# EasyEDA Pro project ProPrj_game_2026-11-26.epro

# Schematic Schematic1
Board Name: Board1; Create Date: 2026-11-06; Page Name: P1; Project Name: game; Schematic Name: Schematic1; Update Date: 2026-11-06; Company: EasyEDA.com; Page Size: A4; Version: V1.0
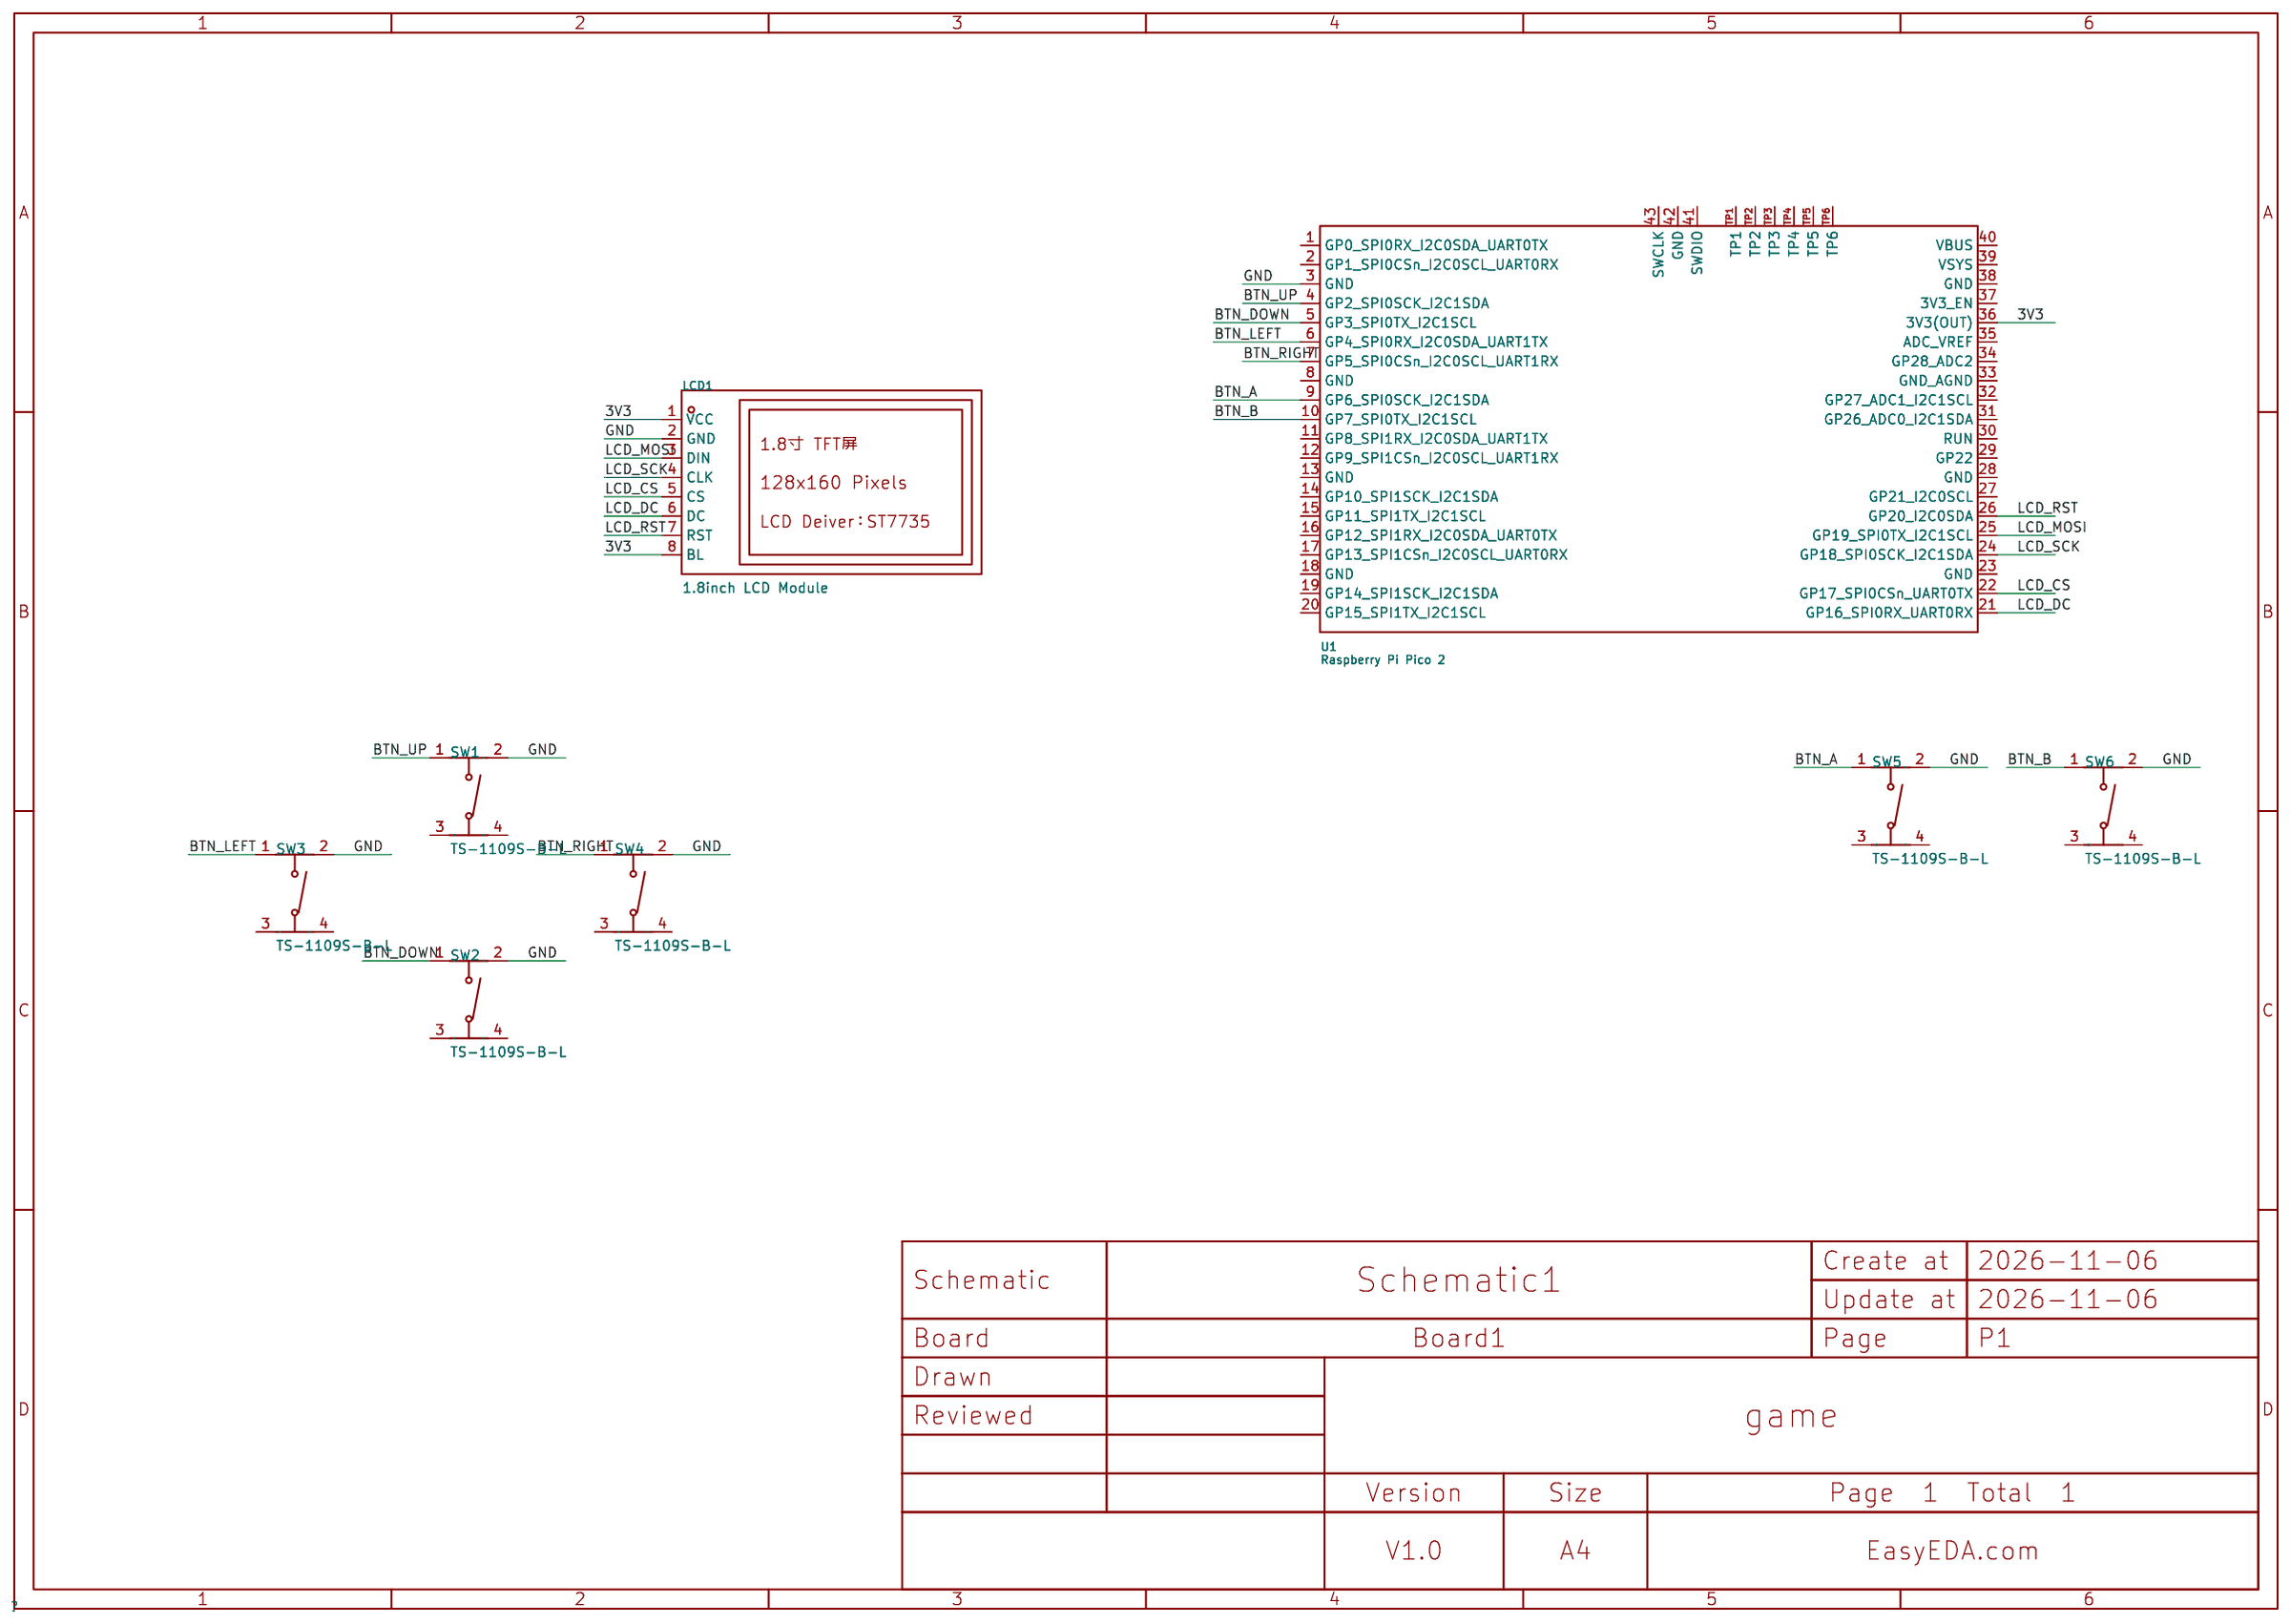
[diagram p0: schematic sheet]

## Parts
LCD1  1.8inch LCD Module  [LCD-TH_L56.5-W34.0_1-8INCH-LCD-MODULE]
SW1  TS-1109S-B-L  [SW-SMD_4P-L4.5-W4.5-P3.00-LS6.8]
SW2  TS-1109S-B-L  [SW-SMD_4P-L4.5-W4.5-P3.00-LS6.8]
SW3  TS-1109S-B-L  [SW-SMD_4P-L4.5-W4.5-P3.00-LS6.8]
SW4  TS-1109S-B-L  [SW-SMD_4P-L4.5-W4.5-P3.00-LS6.8]
SW5  TS-1109S-B-L  [SW-SMD_4P-L4.5-W4.5-P3.00-LS6.8]
SW6  TS-1109S-B-L  [SW-SMD_4P-L4.5-W4.5-P3.00-LS6.8]
U1  Raspberry Pi Pico 2  [COMM-SMD_L51.0-W21.0-P2.54_SC0916]

## Library data of the parts
LCD1 = 1.8inch LCD Module: Controller Type:ST7735S chip Interface:SPI Size:1.8 Dot Pixels:160x128 Operating Temperature:-30℃~+85℃ Operating Temperature:-30℃~+85℃ Display Range:35.4x28.03mm Voltage - Supply:3.3V Voltage - Supply:3.3V Function:Touch; LCSC Part Name: 树莓派 1.8寸LCD 迷你显示屏 扩展板 SPI接口 支持Arduino; Supplier Part: C359940; Manufacturer: Waveshare(微雪电子); JLCPCB Part Class: Extended Part; Datasheet: https://item.szlcsc.com/datasheet/1.8inch%2520LCD%2520Module/334757.html; Supplier: LCSC; Controller Type: ST7735S chip; Interface: SPI; Size: 1.8; Dot Pixels: 160x128; Operating Temperature: -30℃~+85℃; Display Range: 35.4x28.03mm; Voltage - Supply: 3.3V; Function: Touch
SW1-SW6 = TS-1109S-B-L: Circuit:SPST Actuator Style:Round Button Operating Force:160gf Mounting Style:Brick nogging Switch Length:4.5mm Switch Width:4.5mm Switch Height:9mm Strike Gundam:不带 Contact Current:50mA Voltage Rating (DC):12V Insulation Resistance:- Actuator/Cap Color:B; LCSC Part Name: 4.5*4.5*9mm 立贴 轻触开关; Supplier Part: C480325; Manufacturer: XKB Connection(中国星坤); Supplier Footprint: SMD; JLCPCB Part Class: Extended Part; Datasheet: https://atta.szlcsc.com/upload/public/pdf/source/20211011/CFAE96021CF3492A687EDA5E1FB4F9CF.pdf; Supplier: LCSC; Circuit: SPST; Actuator Style: Round Button; Operating Force: 160gf; Mounting Style: Brick nogging; Switch Length: 4.5mm; Switch Width: 4.5mm; Switch Height: 9mm; Strike Gundam: 不带; Contact Current: 50mA; Voltage Rating (DC): 12V; Actuator/Cap Color: Black; With Lamp: No; Mechanical Life: 10万次; Operating Temperature: -30℃~+85℃
U1 = Raspberry Pi Pico 2: LCSC Part Name: SC1631; Supplier Part: C41407547; Manufacturer: Raspberry Pi(树莓派); JLCPCB Part Class: Extended Part; Datasheet: https://item.szlcsc.com/datasheet/Raspberry%2520Pi%2520Pico%25202/43207606.html; Supplier: LCSC

## Nets
3V3: LCD1.1(VCC) LCD1.8(BL) U1.36(3V3(OUT))
GND: LCD1.2(GND) SW1.2 SW2.2 SW3.2 SW4.2 SW5.2 SW6.2 U1.3(GND)
BTN_A: SW5.1 U1.9(GP6_SPI0SCK_I2C1SDA)
BTN_B: SW6.1 U1.10(GP7_SPI0TX_I2C1SCL)
BTN_DOWN: SW2.1 U1.5(GP3_SPI0TX_I2C1SCL)
BTN_LEFT: SW3.1 U1.6(GP4_SPI0RX_I2C0SDA_UART1TX)
BTN_RIGHT: SW4.1 U1.7(GP5_SPI0CSn_I2C0SCL_UART1RX)
BTN_UP: SW1.1 U1.4(GP2_SPI0SCK_I2C1SDA)
LCD_CS: LCD1.5(CS) U1.22(GP17_SPI0CSn_UART0TX)
LCD_DC: LCD1.6(DC) U1.21(GP16_SPI0RX_UART0RX)
LCD_MOSI: LCD1.3(DIN) U1.25(GP19_SPI0TX_I2C1SCL)
LCD_RST: LCD1.7(RST) U1.26(GP20_I2C0SDA)
LCD_SCK: LCD1.4(CLK) U1.24(GP18_SPI0SCK_I2C1SDA)

Not connected (* = marked no-connect by the designer): SW1 3 4; SW2 3 4; SW3 3 4; SW4 3 4; SW5 3 4; SW6 3 4; U1 1(GP0_SPI0RX_I2C0SDA_UART0TX) 2(GP1_SPI0CSn_I2C0SCL_UART0RX) 8(GND) 11(GP8_SPI1RX_I2C0SDA_UART1TX) 12(GP9_SPI1CSn_I2C0SCL_UART1RX) 13(GND) 14(GP10_SPI1SCK_I2C1SDA) 15(GP11_SPI1TX_I2C1SCL) 16(GP12_SPI1RX_I2C0SDA_UART0TX) 17(GP13_SPI1CSn_I2C0SCL_UART0RX) 18(GND) 19(GP14_SPI1SCK_I2C1SDA) 20(GP15_SPI1TX_I2C1SCL) 23(GND) 27(GP21_I2C0SCL) 28(GND) 29(GP22) 30(RUN) 31(GP26_ADC0_I2C1SDA) 32(GP27_ADC1_I2C1SCL) 33(GND_AGND) 34(GP28_ADC2) 35(ADC_VREF) 37(3V3_EN) 38(GND) 39(VSYS) 40(VBUS) 41(SWDIO) 42(GND) 43(SWCLK) TP1 TP2 TP3 TP4 TP5 TP6

# Board PCB1
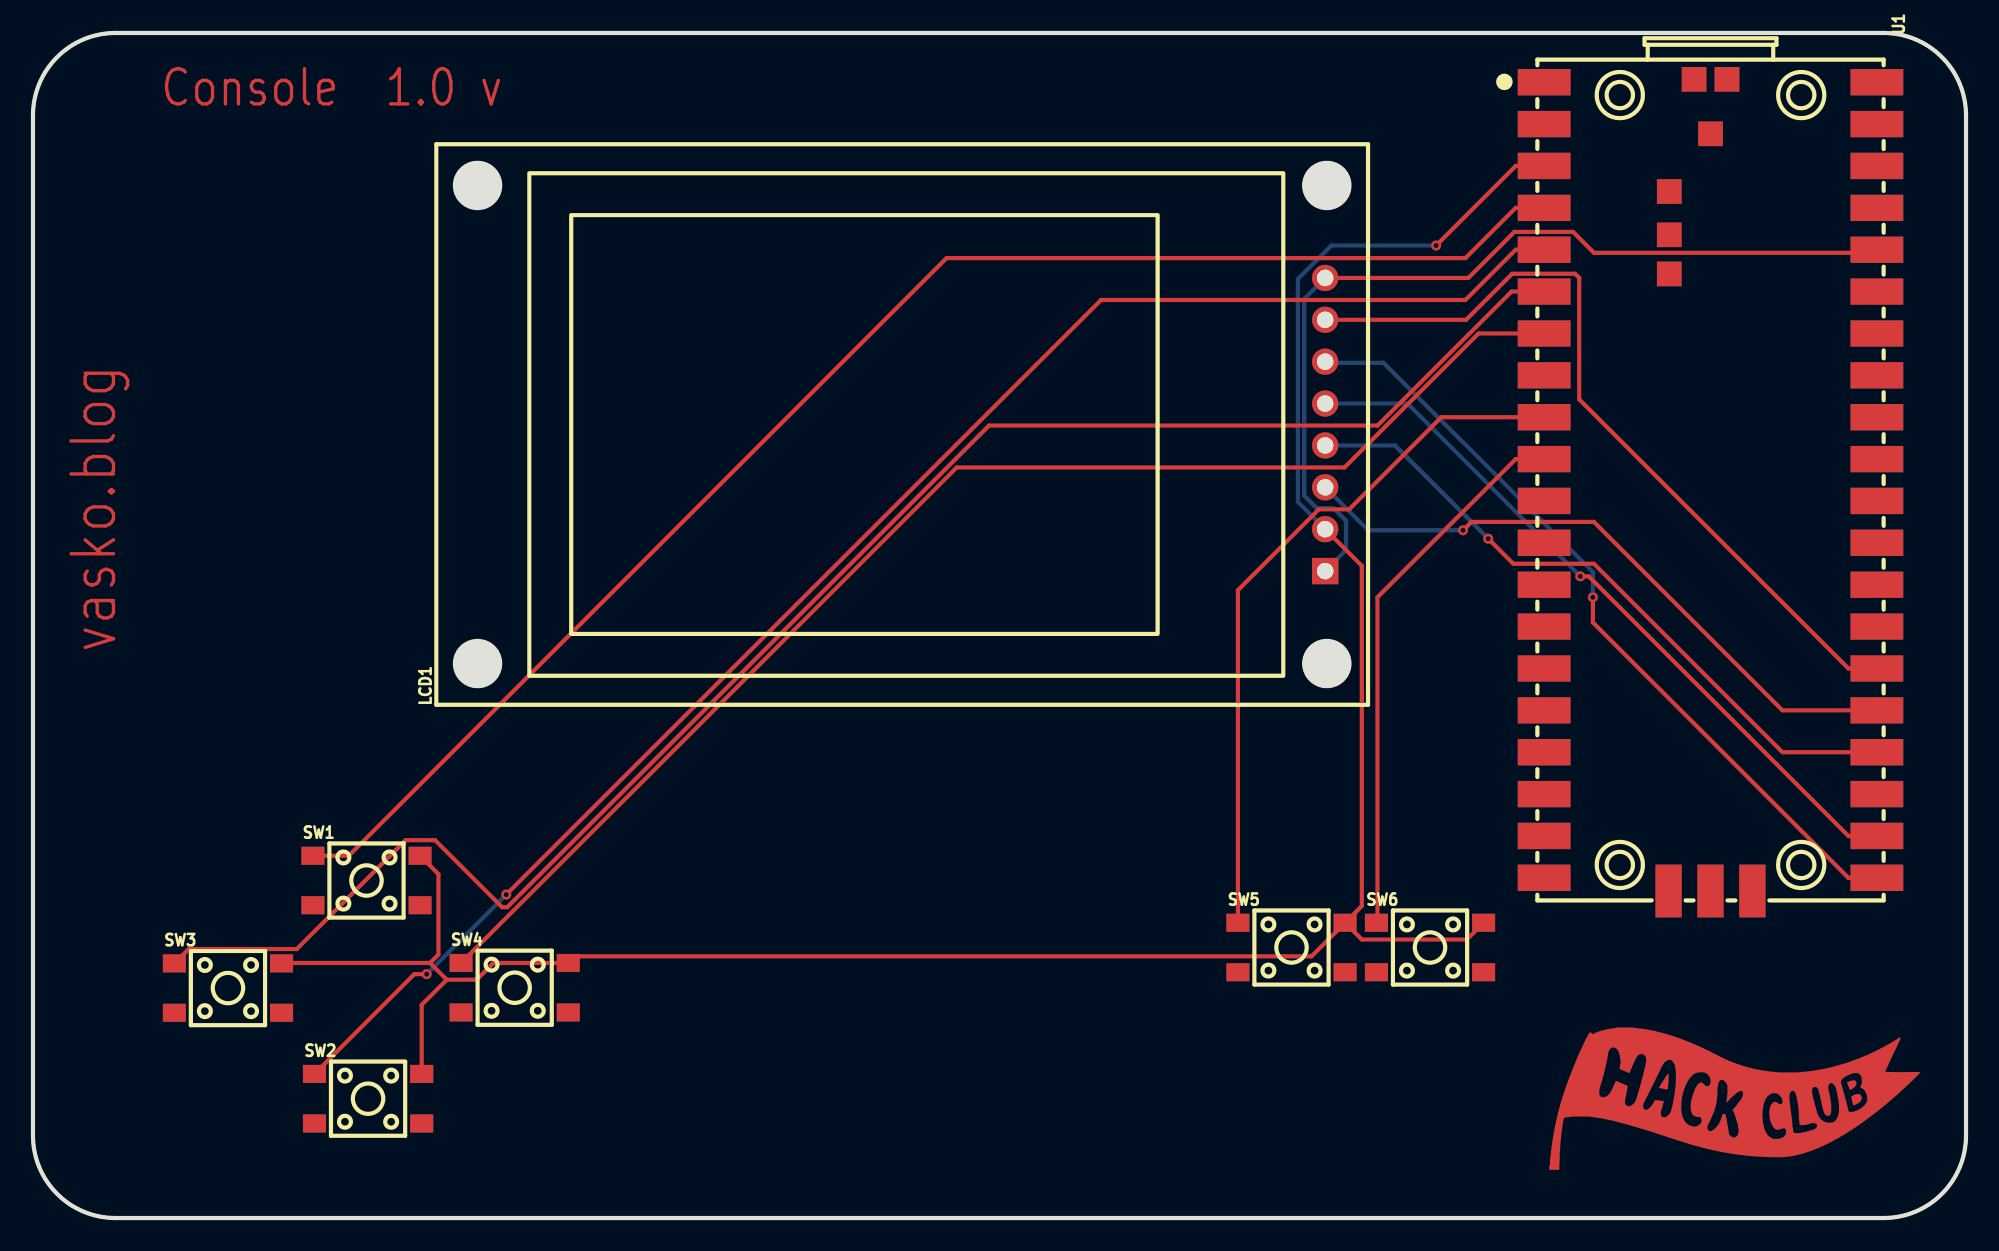
[diagram p1: board, top side]
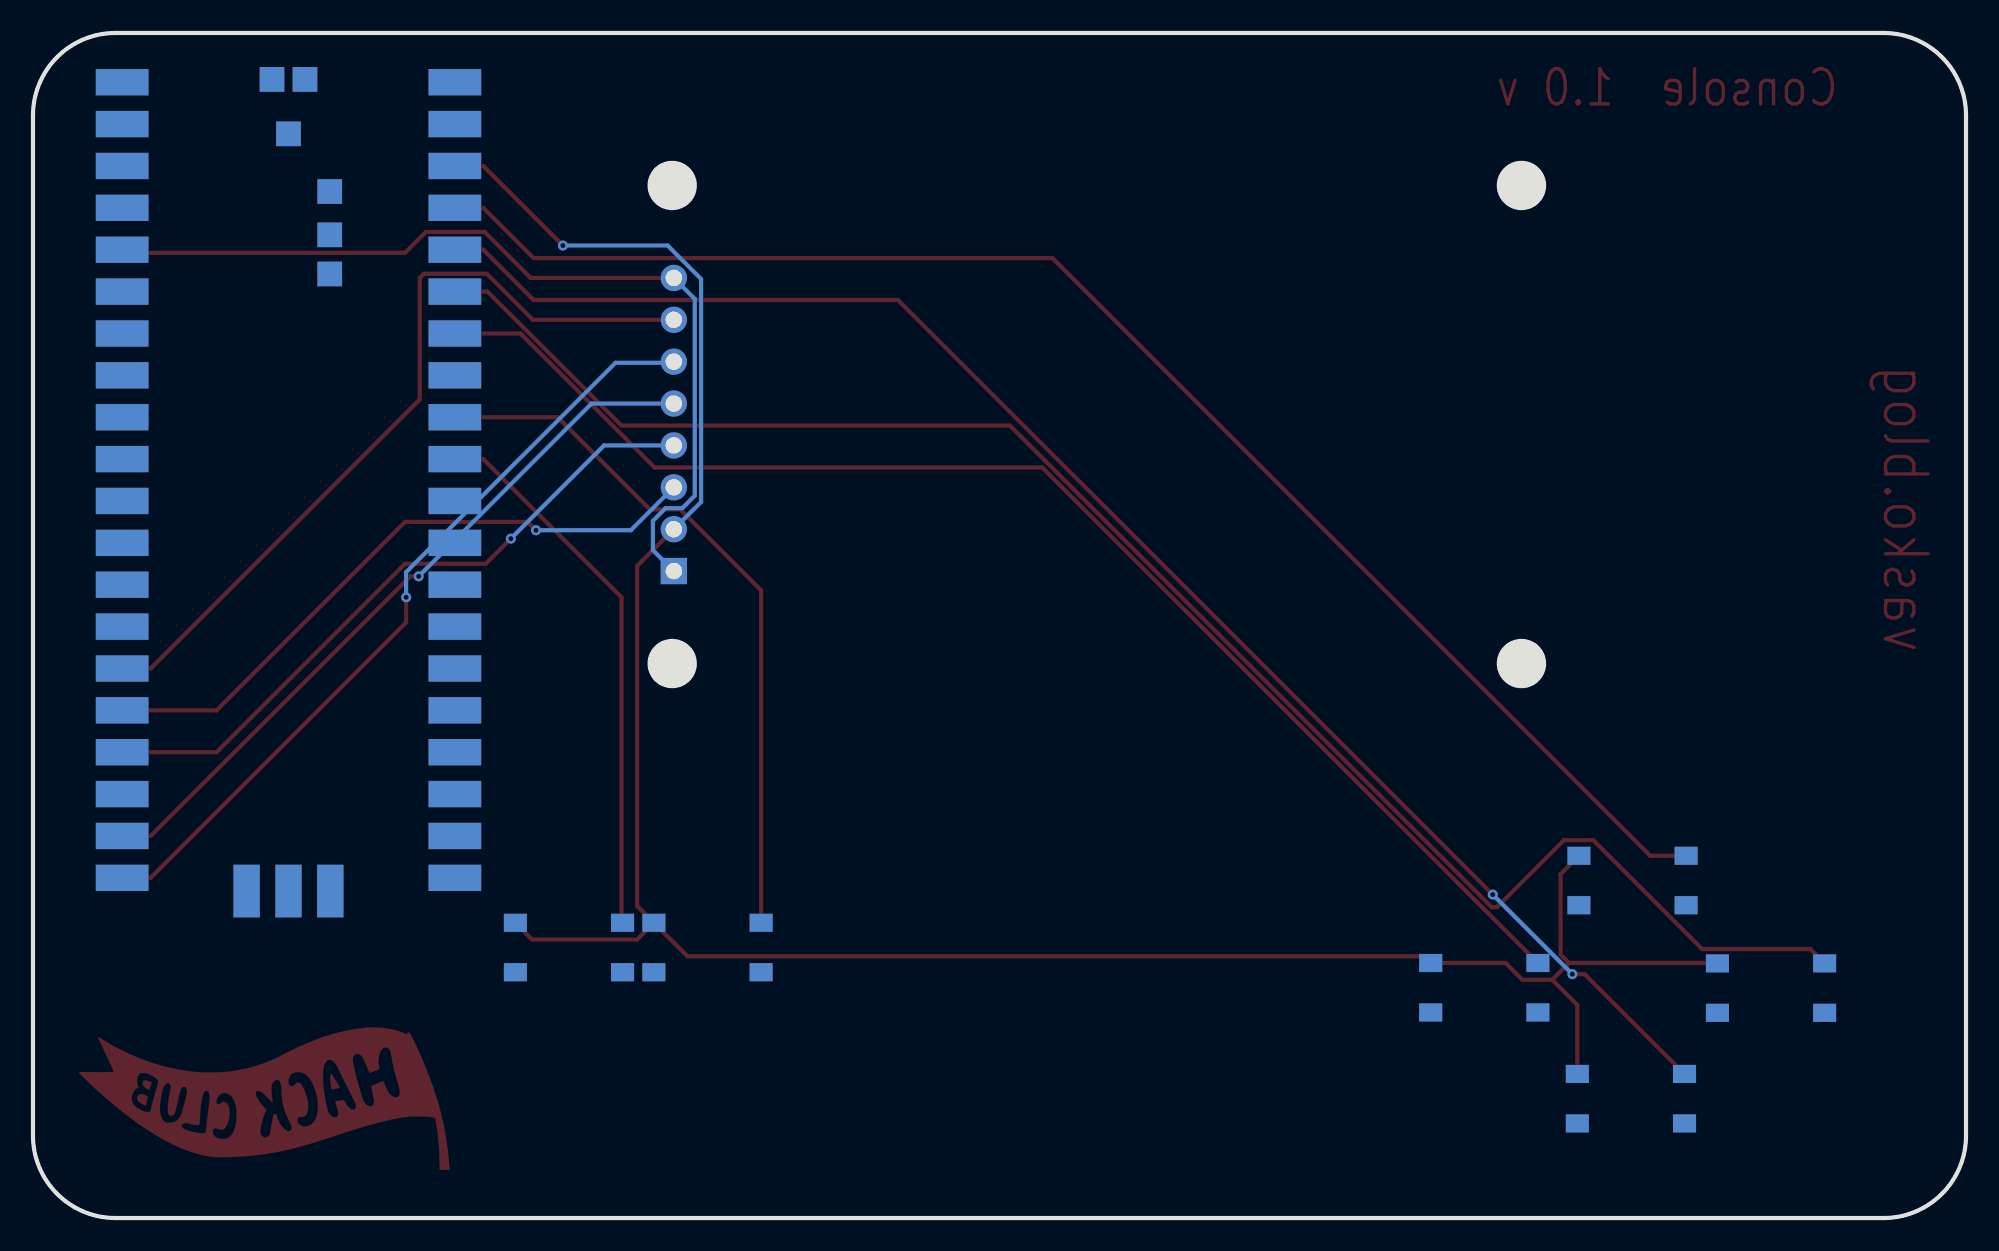
[diagram p2: board, bottom side, seen from below]

Outline 117.22 x 71.88 mm; copper layers: Top Layer, Bottom Layer. Coordinates in mm from the lower left corner of the outline.
Outline path: 0,66.88 0,5 arc(1.46,1.46) 5,0 112.22,0 arc(115.76,1.46) 117.22,5 117.22,66.88 arc(115.76,70.42) 112.22,71.88 5,71.88 arc(1.46,70.42) 0,66.88
Stack: Top Layer 0.035mm / Dielectric1 1.51mm FR4 er 4.5 / Bottom Layer 0.035mm

## Design rules (mm)
spacing copperThickness1oz (default): track to track 0.102, other pairs 0.152 to 0.3
spacing copperThickness2oz: track to track 0.203, other pairs 0.152 to 0.3
track width copperThickness1oz (default): min 0.127, default 0.254, max 2.54
track width copperThickness2oz: min 0.203, default 0.254, max 2.54
differential pair differentialPair (default): width min 0.127, default 0.254, max 2.54; gap min 0.152, default 0.152

## Placement (name value [footprint] x y rotation side)
LCD1  1.8inch LCD Module  [LCD-TH_L56.5-W34.0_1-8INCH-LCD-MODULE]  78.36 48.13 90 top
SW1  TS-1109S-B-L  [SW-SMD_4P-L4.5-W4.5-P3.00-LS6.8]  20.22 20.47 0 top
SW2  TS-1109S-B-L  [SW-SMD_4P-L4.5-W4.5-P3.00-LS6.8]  20.32 7.24 0 top
SW3  TS-1109S-B-L  [SW-SMD_4P-L4.5-W4.5-P3.00-LS6.8]  11.82 13.95 0 top
SW4  TS-1109S-B-L  [SW-SMD_4P-L4.5-W4.5-P3.00-LS6.8]  29.21 13.97 0 top
SW5  TS-1109S-B-L  [SW-SMD_4P-L4.5-W4.5-P3.00-LS6.8]  76.32 16.41 0 top
SW6  TS-1109S-B-L  [SW-SMD_4P-L4.5-W4.5-P3.00-LS6.8]  84.72 16.41 0 top
U1  Raspberry Pi Pico 2  [COMM-SMD_L51.0-W21.0-P2.54_SC0916]  101.73 44.45 270 top

## Footprints (pads in the part's own frame, mm; a bottom-side part is the same pattern mirrored in y, then rotated)
COMM-SMD_L51.0-W21.0-P2.54_SC0916
  rect 1.6x3.2 hole 0.001: 1(-24.445,-10.088) 2(-21.905,-10.088) 3(-19.365,-10.088) 4(-16.825,-10.088) 5(-14.285,-10.088) 6(-11.745,-10.088) 7(-9.205,-10.088) 8(-6.665,-10.088) 9(-4.125,-10.088) 10(-1.585,-10.088) 11(0.955,-10.088) 12(3.495,-10.088) 13(6.035,-10.088) 14(8.575,-10.088) 15(11.115,-10.088) 16(13.655,-10.088) 17(16.195,-10.088) 18(18.735,-10.088) 19(21.275,-10.088) 20(23.815,-10.088) 21(23.815,10.088) 22(21.275,10.088) 23(18.735,10.088) 24(16.195,10.088) 25(13.655,10.088) 26(11.115,10.088) 27(8.575,10.088) 28(6.035,10.088) 29(3.495,10.088) 30(0.955,10.088) 31(-1.585,10.088) 32(-4.125,10.088) 33(-6.665,10.088) 34(-9.205,10.088) 35(-11.745,10.088) 36(-14.285,10.088) 37(-16.825,10.088) 38(-19.365,10.088) 39(-21.905,10.088) 40(-24.445,10.088)
  rect 3.2x1.6 hole 0.001: 41(24.615,-2.54) 42(24.615,0) 43(24.615,2.54)
  rect 1.5x1.5 hole 0.001: TP1(-21.315,0) TP2(-24.615,1) TP3(-24.615,-1) TP4(-17.815,-2.5) TP5(-15.188,-2.5) TP6(-12.815,-2.5)
LCD-TH_L56.5-W34.0_1-8INCH-LCD-MODULE
  rect 1.6x1.6 hole 1: 1(-8.89,0)
  round 1.6 hole 1: 2(-6.35,0) 3(-3.81,0) 4(-1.27,0) 5(1.27,0) 6(3.81,0) 7(6.35,0) 8(8.89,0)
SW-SMD_4P-L4.5-W4.5-P3.00-LS6.8
  rect 1.4x1.1 hole 0.001: 1(-3.25,1.5) 2(3.25,1.5) 3(-3.25,-1.5) 4(3.25,-1.5)

## Nets
As in the schematic.

Pads without a net: SW1 3 4; SW2 3 4; SW3 3 4; SW4 3 4; SW5 3 4; SW6 3 4; U1 1 2 8 11 12 13 14 15 16 17 18 19 20 23 27 28 29 30 31 32 33 34 35 37 38 39 40 41 42 43 TP1 TP2 TP3 TP4 TP5 TP6

## Via types
v1: diameter 0.61, hole 0.305, Top Layer to Bottom Layer, 7 vias

## Routing (per net, layer and track width the routed paths; a pad name or vN(x,y) marks a point on that pad's centre or on a via; arc(x,y) is an arc through that point)
3V3: length 55.7
  Top Layer w0.254: U1.36 111.63,58.55 94.66,58.55 93.39,59.82 89.83,59.82 87.04,57.02 LCD1.8
  Bottom Layer w0.254: LCD1.8 77.09,55.75 77.09,43.81 77.85,43.05 78.87,43.05 79.63,42.29 79.63,40.51 LCD1.1
GND: length 148
  Top Layer w0.254: SW3.2 15.09,15.47 24.08,15.47 ; 24.08,15.47 25.09,14.45 ; 24.08,15.47 24.59,15.98 24.59,20.86 23.47,21.97 ; SW5.2 80.58,18.92 80.58,39.56 LCD1.2 ; SW5.2 77.54,15.88 32.87,15.88 SW4.2 27.92,15.47 26.9,14.45 25.09,14.45 ; SW5.2 80.58,16.89 86.95,16.89 SW6.2 ; U1.3 89.91,63.81 v1(85.09,58.99) ; 25.09,14.45 23.57,12.93 SW2.2
  Bottom Layer w0.254: v1(85.09,58.99) 78.74,58.99 76.7,56.96 76.7,43.44 LCD1.2
BTN_A: length 43.1
  Top Layer w0.254: SW5.1 73.07,38.08 77.97,42.99 79.82,42.99 85.4,48.57 U1.9
BTN_B: length 33.4
  Top Layer w0.254: U1.10 89.91,46.03 81.53,37.65 81.53,17.97 SW6.1
BTN_DOWN: length 95.3
  Top Layer w0.254: SW2.1 23.12,14.79 v1(23.87,14.79) ; U1.5 89.91,58.73 86.86,55.69 64.77,55.69 v1(28.7,19.62)
  Bottom Layer w0.254: v1(28.7,19.62) v1(23.87,14.79)
BTN_LEFT: length 103.3
  Top Layer w0.254: U1.6 89.66,56.19 81.53,48.07 57.97,48.07 28.76,18.86 28.44,18.86 24.38,22.92 22.6,22.92 16,16.32 9.44,16.32 SW3.1
BTN_RIGHT: length 81.5
  Top Layer w0.254: U1.7 87.66,53.65 79.53,45.53 56.02,45.53 SW4.1
BTN_UP: length 90.9
  Top Layer w0.254: SW1.1 19.15,21.97 55.4,58.23 86.86,58.23 89.91,61.27 U1.4
LCD_CS: length 44.3
  Top Layer w0.254: U1.22 110.09,23.17 94.34,38.92 v1(93.83,38.92)
  Bottom Layer w0.254: v1(93.83,38.92) 83.35,49.4 LCD1.5
LCD_DC: length 48.2
  Top Layer w0.254: U1.21 110.09,20.63 94.59,36.13 v1(94.59,37.65)
  Bottom Layer w0.254: LCD1.6 78.42,51.88 81.89,51.88 94.59,39.18 v1(94.59,37.65)
LCD_MOSI: length 39.5
  Top Layer w0.254: v1(86.72,41.72) 87.23,42.22 94.66,42.22 106.09,30.79 U1.25
  Bottom Layer w0.254: v1(86.72,41.72) 80.96,41.72 LCD1.3
LCD_RST: length 48.8
  Top Layer w0.254: LCD1.7 86.91,54.48 89.7,57.28 93.51,57.28 93.77,57.02 93.77,49.66 110.09,33.33 U1.26
LCD_SCK: length 41.2
  Top Layer w0.254: v1(88.24,41.21) 89.77,39.68 94.66,39.68 106.09,28.25 U1.24
  Bottom Layer w0.254: v1(88.24,41.21) 82.59,46.86 LCD1.4

Small or netless copper shapes (teardrops, artwork), in the pictures only: 4 on Top Layer

## Text on the board
Top Layer: Console  1.0 v | vasko.blog
